# Altium schematic sheet USB_Input.SchDoc: USB Input
size A4; SheetNumber: 3; SheetTotal: 9
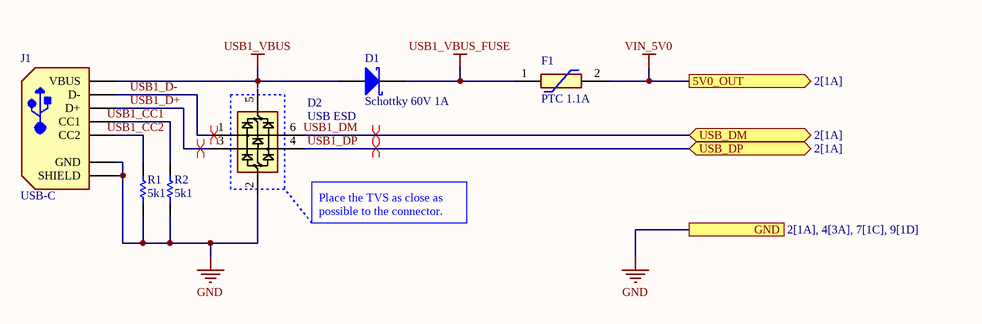
[diagram p0: USB_Input.SchDoc]

## Parts
D1  Schottky 60V 1A  [SOD123 - Nexperia]
D2  USB ESD  [SOT95P280X145-6N]
F1  PTC 1.1A  [LF_1812L010DR]
J1  USB-C  [AMPHENOL_12402012E212A]
R1  value 5k1  [RESC1508X05L - 0603]  (hidden comment: 5.1k)
R2  value 5k1  [RESC1508X05L - 0603]  (hidden comment: 5.1k)

## Ports
5V0_OUT (out, see 2[1A]), GND (see 2[1A], 4[3A], 7[1C], 9[1D]), USB_DM (bidir, see 2[1A]), USB_DP (bidir, see 2[1A])

## Nets
GND: D2.2(GND) J1.A1_B12(GND) J1.SH(SHIELD) R1.1 R2.1 ; port GND
USB1_VBUS: D1.1(A) J1.A4_B4(VBUS)
USB1_VBUS_FUSE: D1.2(K) F1.1
VIN_5V0: F1.2 ; port 5V0_OUT
USB1_CC1: J1.A5(CC1) R2.2
USB1_CC2: J1.B5(CC2) R1.2
USB1_D+: D2.3(I/O2_1) J1.A6_B6(D+)
USB1_D-: D2.1(I/O1_1) J1.A7_B7(D-)
USB1_DM: D2.6(I/O1_2) ; port USB_DM
USB1_DP: D2.4(I/O2_2) ; port USB_DP

Not connected (* = marked no-connect by the designer): D2 5(V_BUS)

## Layout directives
differential pair; differential pair class USB: USB1_D+, USB1_D-, USB1_DM, USB1_DP

## Notes on the sheet
- (near D2) Place the TVS as close as possible to the connector.
- Title:
- Author:
- Size:
- Date:
- Git Hash:
- A4
- Prj:
- SW Version:
- Variant:
- Edited:
- File:

## Library data of the parts
D1 = DIO-SOD123W-SCHOTTKY-60V-1A: Schottky diode 60V 1A SOD-123W; Manufacturer: Nexperia; RoHS Compliant: Yes; Supplier 1: Mouser; Supplier Part Number 1: 771-PMEG6010CEH-T/R
D2 = IC-MPN-USBLC6-2SC6Y: IC USB ESD protection SOT-23-6; Manufacturer_Name: STMicroelectronics; Datasheet Link: https://componentsearchengine.com/Datasheets/1/USBLC6-2SC6Y.pdf; Height: 1.45mm; Manufacturer_Part_Number: USBLC6-2SC6Y; Mouser Part Number: 511-USBLC6-2SC6Y; Mouser Price/Stock: https://www.mouser.co.uk/ProductDetail/STMicroelectronics/USBLC6-2SC6Y?qs=gNDSiZmRJS%2FOgDexvXkdow%3D%3D; Arrow Part Number: USBLC6-2SC6Y; Arrow Price/Stock: https://www.arrow.com/en/products/usblc6-2sc6y/stmicroelectronics?utm_currency=USD&region=nac
F1 = FUS-1812-PTC-1.1A-33V: 33V 1.1A 20A 1.95A 60mΩ 1812 PTC Resettable Fuses ROHS; Manufacturer_Name: LITTELFUSE; Manufacturer_Part_Number: 1812L110/33; Datasheet Link: http://www.littelfuse.com/~/media/electronics/datasheets/resettable_ptcs/littelfuse_ptc_1812l_datasheet.pdf.pdf; Height: 1.25mm; Mouser Part Number: N/A; Mouser Price/Stock: https://www.mouser.co.uk/ProductDetail/Littelfuse/1812L110-33?qs=skbisGc1mWUPu8SxwxrL5A%3D%3D; Supplier 1: Mouser; Supplier Part Number 1: 576-1812L110/33MR
J1 = CON-MPN-12402012E212A: USB-C 2.0 connector 24P; MF: Amphenol ICC (Commercial Products); MP: 12402012E212A; Price: None; Package: None; Availability: In Stock; SnapEDA_Link: https://www.snapeda.com/parts/12402012E212A/Amphenol/view-part/?ref=snap; Value: *; Check_prices: https://www.snapeda.com/parts/12402012E212A/Amphenol/view-part/?ref=eda; Purchase-URL: https://pricing.snapeda.com/search/part/12402012E212A/?ref=eda; Supplier 1: DigiKey; Supplier Part Number 1: 664-12402012E212ACT-ND
R1 R2 = RES-0603-5.1k-1%: 5.1k ±1% 0603 100mW 75V; Part Number: 0402WGF1001TCE; Manufacturer: UNI-ROYAL; Supplier 1: DigiKey; Supplier Part Number 1: 311-5.10KHRCT-ND